# Altium project ESP32C3N.PrjPcb
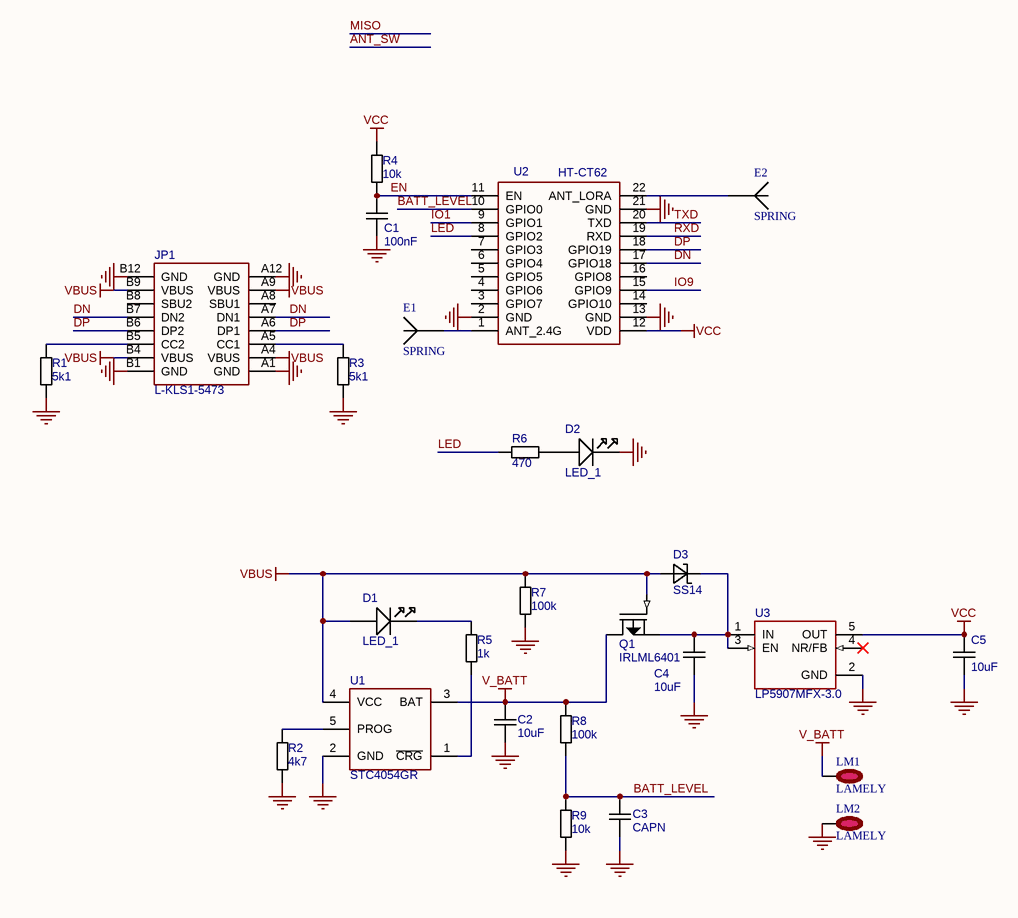
[diagram p0: ESP32C3N.SchDoc]
1 sheet, 26 parts. Net scope: global (net labels, ports and power ports of the same name join across sheets).
Board file: ESP32C3N.PcbDoc

## Sheet ESP32C3N.SchDoc
size 431 x 279 mm; SheetNumber: 1; SheetTotal: 1

### Parts
C1  100nF  [C-0603]
C2  10uF  [C-0805]
C3  CAPN  [C-0603]
C4  10uF  [C-0805]
C5  10uF  [C-0805]
D1  LED_1  [LED_0805]
D2  LED_1  [LED_0805]
D3  SS14  [SOD-323]
E1  SPRING  [SPRING433]
E2  SPRING  [SPRING433]
JP1  L-KLS1-5473  [L-KLS1-5473]
LM1  LAMELY  [PAD2.5X4_SQUARE]  (no BOM)
LM2  LAMELY  [PAD1]  (no BOM)
Q1  IRLML6401  [SOT-23]
R1  5k1  [R-0603]
R2  4k7  [R-0603]
R3  5k1  [R-0603]
R4  10k  [R-0603]
R5  1k  [R-0603]
R6  470  [R-0603]
R7  100k  [R-0603]
R8  100k  [R-0603]
R9  10k  [R-0603]
U1  STC4054GR  [SOT-23-5]
U2  HT-CT62  [HT-CT62]
U3  LP5907MFX-3.0  [SOT-23-5]

### Nets
GND: C1.1 C2.2 C3.2 C4.2 C5.2 D2.K(CATHODE) JP1.A1(GND) JP1.A12(GND) JP1.B1(GND) JP1.B12(GND) LM2.1(Lamely) R1.2 R2.1 R3.2 R7.1 R9.1 U1.2(GND) U2.2(GND) U2.13(GND) U2.21(GND) U3.2(GND)
V_BATT: C2.1 LM1.1(Lamely) Q1.3(DRAIN) R8.2 U1.3(BAT)
VBUS: D1.A(ANODE) D3.1 JP1.A4(VBUS) JP1.A9(VBUS) JP1.B4(VBUS) JP1.B9(VBUS) Q1.1(GATE) R7.2 U1.4(VCC)
VCC: C5.1 R4.1 U2.12(VDD) U3.5(OUT)
BATT_LEVEL: C3.1 R8.1 R9.2 U2.10(GPIO0)
DN: JP1.A7(DN1) JP1.B7(DN2) U2.17(GPIO18)
DP: JP1.A6(DP1) JP1.B6(DP2) U2.18(GPIO19)
EN: C1.2 R4.2 U2.11(EN)
IO1: U2.9(GPIO1)
IO9: U2.15(GPIO9)
LED: R6.2 U2.8(GPIO2)
RXD: U2.19(RXD)
TXD: U2.20(TXD)
NetC4_1: C4.1 D3.2 Q1.2(SOURCE) U3.1(IN) U3.3(EN)
NetD1_K: D1.K(CATHODE) R5.2
NetD2_A: D2.A(ANODE) R6.1
NetE1_1: E1.1 U2.1(ANT_2.4G)
NetE2_1: E2.1 U2.22(ANT_LORA)
NetJP1_A5: JP1.A5(CC1) R3.1
NetJP1_B5: JP1.B5(CC2) R1.1
NetR2_2: R2.2 U1.5(PROG)
NetR5_1: R5.1 U1.1(~{CRG})

Not connected (* = marked no-connect by the designer): JP1 17(VSS) A8(SBU1) B8(SBU2); U2 3(GPIO7) 4(GPIO6) 5(GPIO5) 6(GPIO4) 7(GPIO3) 14(GPIO10) 16(GPIO8); U3 4(NR/FB)*

### Notes on the sheet
- DWG. NO.
- REV.
- SHT.
- THIS DOCUMENT AND THE DATA DISCLOSED HEREIN OR HEREWITH IS THE PROPERTY OF ALTIUM LIMITED AND MAY BE FREELY DISTRIBUTED IN WHOLE. NO RIGHTS ARE RESERVED OR EXPRESS OR IMPLIED WARANTEE GIVEN.
- REVISION
- DESCRIPTION
- DATE
- APPROVED
- ENG:
- APPROVALS
- PROJECT
- DSN:
- CHK:
- REFERENCE DOCUMENTS
- PROJECT REVISION:
- TITLE
- DOCUMENT REVISION:
- DESIGN ITEM:
- BOM:
- FAB DWG:
- PCB DWG:
- ASSY DWG:
- SCALE:
- SIZE
- B
- CAGE CODE
- FILE NAME
- DWG NO.
- SHEET
- OF
- REV

### Library data of the parts
C1-C5 = CAPN: Voltage: 50V; Точність/група: NP0; Вид: Конденсатор
D1 D2 = LED_1: Вид: Світлодіод
D3 = DIODSH: Вид: Діод
E1 E2 = ANT: Примітки: Пряма; Вид: Антена
JP1 = L-KLS1-5473: Mounting  Method: SMD; Value: *
LM1 LM2 = LAMELY: Вид: Роз'єм; *: *
Q1 = MOSF-P: Вид: Транзистор
R1-R9 = RES: Точність/група: 5%; Вид: Резистор
U1 = STC4054
U3 = LP5907: 250mA Low-Dropout Regulator; Вид: Мікросхема
U2 = HT-CT62: Value: HT-CT62